# Altium schematic sheet pyPhotometry.SchDoc
size 320 x 200 mm; SheetNumber: 1; SheetTotal: 1
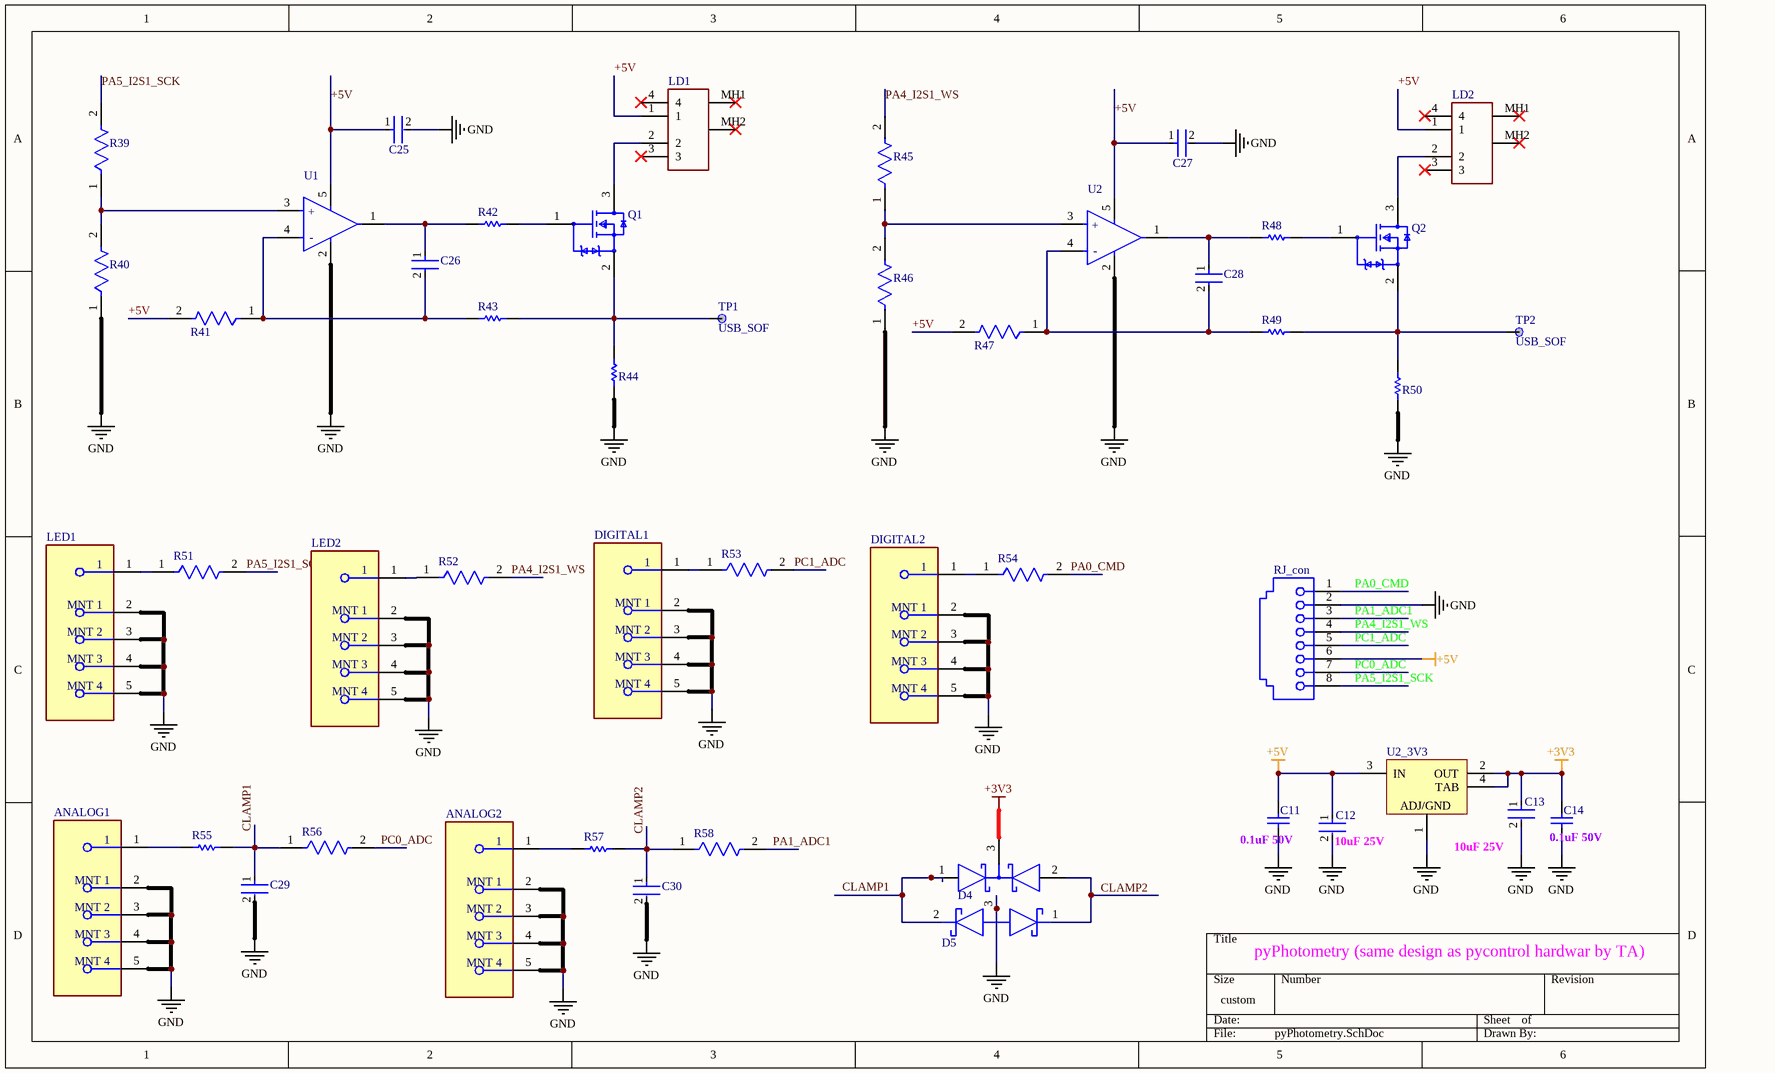
[diagram p0: pyPhotometry.SchDoc]

## Parts
ANALOG1  1-1337445-0  [FP-1-1337445-0-MFG]  (value not drawn)
ANALOG2  1-1337445-0  [FP-1-1337445-0-MFG]  (value not drawn)
C11  GRM188R71H104KA93D  [CAPC1608X90X35ML10T15]  (value not drawn)
C12  CC1206KKX5R8BB105  [FP-CC1206-1_25-MFG]  (value not drawn)
C13  CC1206KKX5R8BB105  [FP-CC1206-1_25-MFG]  (value not drawn)
C14  GRM188R71H104KA93D  [CAPC1608X90X35ML10T15]  (value not drawn)
C25  CC0603KRX7R9BB153  [FP-CC0603-DA-MFG]  (value not drawn)
C26  CC0603KRX7R9BB153  [FP-CC0603-DA-MFG]  (value not drawn)
C27  CC0603KRX7R9BB153  [FP-CC0603-DA-MFG]  (value not drawn)
C28  CC0603KRX7R9BB153  [FP-CC0603-DA-MFG]  (value not drawn)
C29  CC0603KRX7R9BB153  [FP-CC0603-DA-MFG]  (value not drawn)
C30  CC0603KRX7R9BB153  [FP-CC0603-DA-MFG]  (value not drawn)
D4  BAR43CFILM  [FP-SOT23-3L-MFG]  (value not drawn)
D5  BAR43AFILM  [SOT105P242X150-3N]  (value not drawn)
DIGITAL1  1-1337445-0  [FP-1-1337445-0-MFG]  (value not drawn)
DIGITAL2  1-1337445-0  [FP-1-1337445-0-MFG]  (value not drawn)
LD1  T4041037041-000  [T4041037041000]  (value not drawn)
LD2  T4041037041-000  [T4041037041000]  (value not drawn)
LED1  1-1337445-0  [FP-1-1337445-0-MFG]  (value not drawn)
LED2  1-1337445-0  [FP-1-1337445-0-MFG]  (value not drawn)
Q1  DMG2302UK-7  [FP-SOT23-MFG]  (value not drawn)
Q2  DMG2302UK-7  [FP-SOT23-MFG]  (value not drawn)
R39  RT0603FRD07100RL  [FP-RT0603-MFG]  (value not drawn)
R40  RT0603FRD07100RL  [FP-RT0603-MFG]  (value not drawn)
R41  RT0603FRD07100RL  [FP-RT0603-MFG]  (value not drawn)
R42  RC0603JR-071KL  [RESC1608X55X25ML10T15]  (value not drawn)
R43  RC0603JR-071KL  [RESC1608X55X25ML10T15]  (value not drawn)
R44  RC0603JR-071KL  [RESC1608X55X25ML10T15]  (value not drawn)
R45  RT0603FRD07100RL  [FP-RT0603-MFG]  (value not drawn)
R46  RT0603FRD07100RL  [FP-RT0603-MFG]  (value not drawn)
R47  RT0603FRD07100RL  [FP-RT0603-MFG]  (value not drawn)
R48  RC0603JR-071KL  [RESC1608X55X25ML10T15]  (value not drawn)
R49  RC0603JR-071KL  [RESC1608X55X25ML10T15]  (value not drawn)
R50  RC0603JR-071KL  [RESC1608X55X25ML10T15]  (value not drawn)
R51  RT0603FRD07100RL  [FP-RT0603-MFG]  (value not drawn)
R52  RT0603FRD07100RL  [FP-RT0603-MFG]  (value not drawn)
R53  RT0603FRD07100RL  [FP-RT0603-MFG]  (value not drawn)
R54  RT0603FRD07100RL  [FP-RT0603-MFG]  (value not drawn)
R55  RC0603JR-071KL  [RESC1608X55X25ML10T15]  (value not drawn)
R56  RT0603FRD07100RL  [FP-RT0603-MFG]  (value not drawn)
R57  RC0603JR-071KL  [RESC1608X55X25ML10T15]  (value not drawn)
R58  RT0603FRD07100RL  [FP-RT0603-MFG]  (value not drawn)
RJ_con  615008138021  [615008138021]  (value not drawn)
TP1  USB_SOF  [TP]
TP2  USB_SOF  [TP]
U1  OPA197IDBVT  [FP-DBV0005A-IPC_C]  (value not drawn)
U2  OPA197IDBVT  [FP-DBV0005A-IPC_C]  (value not drawn)
U2_3V3  NCP1117ST33T3G  [ONSC-SOT-223-4-318H-01_A_V]  (value not drawn)

## Nets
+3V3: C13.1 C14.2 D4.3(K) U2_3V3.2(OUT) U2_3V3.4(TAB)
+5V: C11.2 C12.1 C25.1 C27.1 LD1.1 LD2.1 R41.2 R47.2 RJ_con.6 U1.5(V+) U2.5(V+) U2_3V3.3(IN)
GND: ANALOG1.2(MNT_1) ANALOG1.3(MNT_2) ANALOG1.4(MNT_3) ANALOG1.5(MNT_4) ANALOG2.2(MNT_1) ANALOG2.3(MNT_2) ANALOG2.4(MNT_3) ANALOG2.5(MNT_4) C11.1 C12.2 C13.2 C14.1 C25.2 C27.2 C29.2 C30.2 D5.3(A) DIGITAL1.2(MNT_1) DIGITAL1.3(MNT_2) DIGITAL1.4(MNT_3) DIGITAL1.5(MNT_4) DIGITAL2.2(MNT_1) DIGITAL2.3(MNT_2) DIGITAL2.4(MNT_3) DIGITAL2.5(MNT_4) LED1.2(MNT_1) LED1.3(MNT_2) LED1.4(MNT_3) LED1.5(MNT_4) LED2.2(MNT_1) LED2.3(MNT_2) LED2.4(MNT_3) LED2.5(MNT_4) R40.1 R44.1 R46.1 R50.1 RJ_con.2 U1.2(V-) U2.2(V-) U2_3V3.1(ADJ/GND)
CLAMP1: C29.1 D4.1(A1) D5.2(K1) R55.2 R56.1
CLAMP2: C30.1 R57.2 R58.1
PA0_CMD: R54.2 RJ_con.1
PA1_ADC1: R58.2 RJ_con.3
PA4_I2S1_WS: R45.2 R52.2 RJ_con.4
PA5_I2S1_SCK: R39.2 R51.2 RJ_con.8
PC0_ADC: R56.2 RJ_con.7
PC1_ADC: R53.2 RJ_con.5
NetANALOG1_1: ANALOG1.1 R55.1
NetANALOG2_1: ANALOG2.1 R57.1
NetC26_1: C26.1 R42.1 U1.1(OUT)
NetC26_2: C26.2 R41.1 R43.1 U1.4(-IN)
NetC28_1: C28.1 R48.1 U2.1(OUT)
NetC28_2: C28.2 R47.1 R49.1 U2.4(-IN)
NetD4_2: D4.2(A2) D5.1(K2)
NetDIGITAL1_1: DIGITAL1.1 R53.1
NetDIGITAL2_1: DIGITAL2.1 R54.1
NetLD1_2: LD1.2 Q1.3(D)
NetLD2_2: LD2.2 Q2.3(D)
NetLED1_1: LED1.1 R51.1
NetLED2_1: LED2.1 R52.1
NetQ1_1: Q1.1(G) R42.2
NetQ1_2: Q1.2(S) R43.2 R44.2 TP1.1
NetQ2_1: Q2.1(G) R48.2
NetQ2_2: Q2.2(S) R49.2 R50.2 TP2.1
NetR39_1: R39.1 R40.2 U1.3(+IN)
NetR45_1: R45.1 R46.2 U2.3(+IN)

Not connected (* = marked no-connect by the designer): LD1 3* 4* MH1* MH2*; LD2 3* 4* MH1* MH2*

## Notes on the sheet
- (near C11) 0.1uF 50V
- (near C12) 10uF 25V
- 10uF 25V
- (near C14) 0.1uF 50V
- pyPhotometry (same design as pycontrol hardwar by TA)
- Labels drawn without touching a wire or pin: CLAMP2
- (in symbol CMP-04895-000163-1) +; -

## Library data of the parts
ANALOG1 ANALOG2 DIGITAL1 DIGITAL2 = CMP-03357-000006-1: CONN BNC JACK STR 50 OHM PCB; PCB Mount Retention: With; Operating Frequency: 0 to 4Hz; PCB Mounting Orientation: Vertical; PCB Thickness: 0.126inch; Body Plating: Silver; Frequency: 4GHz; Impedance: 50R; Insulation Resistance: 5GR; Body Material: Brass; Dielectric Material: PTFE; Gender: Female; Sealable: No (Without); Number of Positions: 1; Orientation: Straight; RoHS Compliant: Yes; Min Operating Temperature: -65°C; Packaging: Bag; Fastening Type: Bayonet; Radiation Hardening: No; Max Frequency: 4GHz; Material: Brass; Contact Plating: Silver; ELV: Compliant; Depth: 12mm; Series: BNC; Package Quantity: 50; Connector Type: BNC; Contact Material: Brass; Max Operating Temperature: 165°C; Length: 12mm; Termination: Solder; Mount: Through Hole; Insulation Material: Polytetrafluoroethylene
C11 C14 = CMP-2100-03643-1: Chip Capacitor, 0.1 uF, +/- 10%, 50 V, -55 to 125 degC, 0603 (1608 Metric), RoHS, Tape and Reel (C77055); Manufacturer: Murata; Dielectric Material: Ceramic; Voltage Rating: 50V; Capacitance: 100nF; Dielectric: X7R; Insulation Resistance: 10GR; Case Code (Metric): 1608; Lead Free: LeadFree; Depth: 0.8mm; Number of Pins: 2; Radiation Hardening: No; Case/Package: 0603; Manufacturer URL: http://www.murata.com/; Packaging: TapeandReel; Length: 1.6mm; Contact Plating: Tin; Datasheet URL: http://psearch.en.murata.com/capacitor/product/GRM188R71H104KA93%23.pdf; Tolerance: 10%; Case Code (Imperial): 0603; Min Operating Temperature: -55degC; RoHSCompliant: true; Voltage: 50V; Termination: SMD/SMT; Mount: SurfaceMount; Material: Ceramic; Package Quantity: 1; Height: 0.8mm; Thickness: 0.035inch; REACH SVHC: NoSVHC; Max Operating Temperature: 125degC; Width: 0.8mm; Package Reference: 0603; Voltage Rating (DC): 50V; Datasheet Version: 42675.0; Package Description: 2-Pin Surface Mount Device, Body 1.6 x 0.8 mm
C12 C13 = CMP-03422-001167-1: 10uF 25V X5R ±10% 1206 Multilayer Ceramic Capacitors MLCC - SMD/SMT ROHS (C128855); Manufacturer: Yageo; Temperature Coefficient: 15%; Value: 1 uF; Tolerance: 0.1; Automotive Grade: NA; Temperature: -55°C to +125°C; Footprint Url: http://www.yageo.com/exep/pages/download/literatures/UPY-C_GEN_24.pdf; Lead Free: Yes; Device Class L2: Capacitors; Temperature Range High: +125°C; Manufacturer Part Number: CC1206KKX5R8BB105; Voltage Rating: 25 V; ComponentLink2Description: Datasheet; Device Class L3: Ceramic Capacitors; RoHS: TRUE; Temperature Characteristic: X5R; Digikey Description: CAP CER 1UF 25V X5R 1206; Mouser Description: Multilayer Ceramic Capacitors MLCC - SMD/SMT 1.0uF 25V X5R 10%; Capacitance: 1 uF; Material: Ceramic; Height: 1.45mm; Automotive: No; Category: Cap; Octopart: https://octopart.com/cc1206kkx5r8bb105-yageo-20779154; ComponentLink2URL: http://www.yageo.com/documents/recent/UPY-NP0X7R_HV_1KV-to-3KV_11.pdf; Package: CC1206-1.25; Device Class L1: Passive Components; Temperature Range Low: -55°C
C25-C30 = CMP-03422-000725-1: CAP CER 0.015UF 50V X7R 0603 (C107076); Manufacturer: YAGEO; Tolerance: 0.1; Value: 15 nF; Material: Ceramic; Temperature Coefficient: 15%; Automotive: No; Height: 0.9mm; Device Class L3: Ceramic Capacitors; Category: Cap; Octopart: https://octopart.com/cc0603krx7r9bb153-yageo-42334129; Device Class L2: Capacitors; Digikey Description: CAP CER 0.015UF 50V X7R 0603; Manufacturer Part Number: CC0603KRX7R9BB153; Device Class L1: Passive Components; Footprint Url: http://www.yageo.com/exep/pages/download/literatures/UPY-C_GEN_24.pdf; Capacitance: 15 nF; ComponentLink2URL: http://www.yageo.com/documents/recent/UPY-GPHC_X7R_6.3V-to-50V_18.pdf; Temperature: -55°C to +125°C; Voltage: 50 V; Temperature Characteristic: X7R; Voltage Rating: 50 V; Mouser Description: Multilayer Ceramic Capacitors MLCC - SMD/SMT 15nF 50V X7R 10%; ComponentLink2Description: Datasheet; Lead Free: Yes; RoHS: TRUE; Package: CC0603-DA; Temperature Range Low: -55°C; Temperature Range High: +125°C
D4 = CMP-12187-000004-1: DIODE ARRAY SCHOTTKY 30V SOT23-3 (C69290); Manufacturer: STMicroelectronics; Peak Reverse Current: 0.5uA; Forward Current: 0.1A; Standoff Height: 0mm; Capacitance: 7pF; Max Surge Forward Current: 0.75A; Value: 7pF; Max Junction Temp: +150°C; ComponentLink2Description: Datasheet; Device Class L2: Diodes; Temperature Range High: +150°C; Device Class L1: Discrete Semiconductors; ComponentLink2URL: https://www.st.com/resource/en/datasheet/bar43.pdf; Package: SOT23-3L; Lead Free: Yes; Temperature: to +150°C; Category: Diode; Digikey Description: DIODE ARRAY SCHOTTKY 30V SOT23-3; Manufacturer Part Number: BAR43CFILM; Automotive: No; Mouser Description: Schottky Diodes & Rectifiers 100mA 30 Volt; Height: 1.5mm; Max Repetitive Reverse Voltage: 30V; RoHS: TRUE; Octopart: https://octopart.com/bar43cfilm-stmicroelectronics-39683191; Device Class L3: Schottky Diodes; Reverse Voltage: 30V
D5 = BAR43AFILM: Schottky Diode with Dual Cathode; Manufacturer_Name: STMicroelectronics; Datasheet Link: http://www.st.com/web/en/resource/technical/document/datasheet/CD00000764.pdf; Height: 1.5mm; Manufacturer_Part_Number: BAR43AFILM; Mouser Part Number: 511-BAR43AFILM; Mouser Price/Stock: https://www.mouser.co.uk/ProductDetail/STMicroelectronics/BAR43AFILM?qs=V1woAGgG1aNxI05DoB34wA%3D%3D; Arrow Part Number: BAR43AFILM; Arrow Price/Stock: https://www.arrow.com/en/products/bar43afilm/stmicroelectronics?utm_currency=USD&region=europe
LD1 LD2 = T4041037041-000: Connector; Manufacturer_Name: TE Connectivity; Datasheet Link: https://www.te.com/commerce/DocumentDelivery/DDEController?Action=srchrtrv&DocNm=1-1773701-8_M8M12_CONNECTOR_SYSTEM&DocType=Catalog%20Section&DocLang=Japanese&PartCntxt=T4041037041-000&DocFormat=pdf; Height: 15.25mm; Manufacturer_Part_Number: T4041037041-000; Mouser Part Number: 571-T4041037041-000; Mouser Price/Stock: https://www.mouser.co.uk/ProductDetail/TE-Connectivity/T4041037041-000?qs=1mbolxNpo8e0ryuUhGdttQ%3D%3D; Arrow Part Number: T4041037041-000; Arrow Price/Stock: https://www.arrow.com/en/products/t4041037041-000/te-connectivity?utm_currency=USD&region=europe
LED1 LED2 = CMP-03357-000006-1: CONN BNC JACK STR 50 OHM PCB; PCB Mount Retention: With; Operating Frequency: 0 to 4Hz; PCB Mounting Orientation: Vertical; PCB Thickness: 0.126inch; Body Plating: Silver; Frequency: 4GHz; Impedance: 50R; Insulation Resistance: 5GR; Material: Brass; Dielectric Material: PTFE; Gender: Female; Sealable: No (Without); Number of Positions: 1; Orientation: Straight; RoHS Compliant: Yes; Min Operating Temperature: -65°C; Packaging: Bag; Fastening Type: Bayonet; Radiation Hardening: No; Max Frequency: 4GHz; Contact Plating: Silver; ELV: Compliant; Body Material: Brass; Depth: 12mm; Series: BNC; Package Quantity: 50; Connector Type: BNC; Contact Material: Brass; Max Operating Temperature: 165°C; Length: 12mm; Termination: Solder; Mount: Through Hole; Insulation Material: Polytetrafluoroethylene
Q1 Q2 = CMP-12801-000001-1: MOSFET N-CH 20V 2.8A SOT23; Manufacturer: Diodes Inc.; Reverse Recovery Time: 5.3ns; Gate Charge At Vgs: 2.8nC @ 10V; Turn On Delay Time: 0.6ns; Pulse Drain Current: 12A; Max Forward Diode Voltage: 1.2V; Reverse Recovery Charge: 0.5nC; Automotive Grade: Grade 0; Threshold Vgs Min: 0.3V; Number Of N Channels: 1; Standoff Height: 0.013mm; Typ Forward Diode Voltage: 0.7V; Drain To Source Resistance: 61mΩ; Rthja Max: 192°C/W; Max Junction Temp: +150°C; Input Capacitace At Vds: 130pF @ 10V; Threshold Vgs Max: 1V; Turn Off Delay Time: 4.2ns; Depletion Mode: False; Gate To Source Voltage: 12V; Power Dissipation: 0.66W; Device Class L1: Discrete Semiconductors; Footprint Url: https://www.diodes.com/assets/Package-Files/SOT23.pdf; Lead Free: Yes; Manufacturer Part Number: DMG2302UK-7; Temperature Range High: +150°C; Drain To Source Voltage: 20V; Category: Trans; Digikey Description: MOSFET N-CH 20V 2.8A SOT23; RoHS: TRUE; Device Class L2: Transistors; Height: 1.1mm; Automotive: Yes; Package: SOT23; Drain To Source Breakdown Voltage: 20V; Continuous Drain Current: 2.8A; ComponentLink2Description: Datasheet; Device Class L3: MOSFETs; Octopart: https://octopart.com/dmg2302uk-7-diodes+inc.-73850182; Temperature Range Low: -55°C; Temperature: -55°C to +150°C; Number Of Channels: 1; ComponentLink2URL: https://www.diodes.com/assets/Datasheets/DMG2302UK.pdf
R39-R41 R45-R47 R51-R54 R56 R58 = CMP-03412-020531-1: RES SMD 100 OHM 1% 1/10W 0603 (C160603)s; Manufacturer: Yageo; Value: 100Ω; Power Rating: 0.1W; Voltage Rating: 75V; Tolerance: 0.01; Temperature Coefficient: 25 ppm/°C; Device Class L2: Resistors; Temperature Range Low: -55°C; ComponentLink2Description: Datasheet; Digikey Description: RES SMD 100 OHM 1% 1/10W 0603; Category: Res; Composition: Thin Film; Mouser Description: High Precision-High Stability Chip Resistor Thin Film 0603 100Ohm 1% Paper T/R; Temperature Range High: +155°C; RoHS: TRUE; Device Class L3: Chip SMD Resistors; Footprint Url: http://www.yageo.com/exep/pages/download/literatures/PYu-R_Mount_10.pdf; Octopart: https://octopart.com/rt0603frd07100rl-yageo-71395265; Manufacturer Part Number: RT0603FRD07100RL; ComponentLink2URL: http://www.yageo.com/documents/recent/PYu-RT_1-to-0.01_RoHS_L_9.pdf; Temperature: -55°C to +155°C; Lead Free: Yes; Height: 0.55mm; Device Class L1: Passive Components; Package: RT0603; Automotive: No; Series: RT; Ipc Land Pattern Name: RESC16080X45; Resistance: 100Ω
R42-R44 R48-R50 R55 = CMP-2000-05023-1: Chip Resistor, 1 KOhm, +/- 5%, 0.063 W, -55 to 155 degC, 0603 (1608 Metric), RoHS, Tape and Reel (C14676); Manufacturer: Yageo; Resistor Case Style: 0603[1608Metric]; Resistor Element Type: ThickFilm; Product Range: RCSeries; Resistance: 1kohm; SVHC: ToBeAdvised; Voltage Rating: 50V; Temperature Coefficient: ±100ppm/degC; Power Rating: 100mW; Packaging: CutTape; Manufacturer URL: http://www.yageo.com/; Resistance Tolerance: ±5%; Datasheet Version: Rev. 4, 04/2009; MSL: MSL1-Unlimited; Package Description: 2-Pin Surface Mount Device, Body 1.6 x 0.8 mm; Automotive Qualification Standard: -; Package Reference: 603; Datasheet URL: https://datasheet.ciiva.com/2452/pyu-rc0603-51-rohs-l-4-2452848.pdf
R57 = CMP-2000-05023-1: Chip Resistor, 1 KOhm, +/- 5%, 0.063 W, -55 to 155 degC, 0603 (1608 Metric), RoHS, Tape and Reel (C14676)s; Manufacturer: Yageo; Resistor Case Style: 0603[1608Metric]; Resistor Element Type: ThickFilm; Product Range: RCSeries; Resistance: 1kohm; SVHC: ToBeAdvised; Voltage Rating: 50V; Temperature Coefficient: ±100ppm/degC; Power Rating: 100mW; Packaging: CutTape; Manufacturer URL: http://www.yageo.com/; Resistance Tolerance: ±5%; Datasheet Version: Rev. 4, 04/2009; MSL: MSL1-Unlimited; Package Description: 2-Pin Surface Mount Device, Body 1.6 x 0.8 mm; Automotive Qualification Standard: -; Package Reference: 603; Datasheet URL: https://datasheet.ciiva.com/2452/pyu-rc0603-51-rohs-l-4-2452848.pdf
RJ_con = CMP-1502-01725-1: Modular Jack WR-MJ, Plastic, Vertical Entry, THT, 8P8C (C86492); Manufacturer: Wurth Elektronik; Withstanding Voltage: 1000VAC; Contact Resistance: 20mOhm; Port: 1x1; Working Voltage: 120VAC; Rated Current: 1.5A; Compliance: Leadfree/RoHS; Entrance: Vertical; Publisher: WurthElektronik; Datasheet URL: https://katalog.we-online.de/em/datasheet/615008138021.pdf; Part Number: 615008138021; Manufacturer URL: http://www.we-online.de; Pin Number: 8P8C; Mounting Technology: THT; Operating Temperature: -40to85degC; Package Reference: 615008138021; Packaging: Tray
TP1 TP2 = TP
U1 U2 = CMP-04895-000163-1: IC OPAMP GP 1 CIRCUIT SOT23-5; Output Current per Channel: 65mA; Number of Channels: 1; Input Offset Voltage (Vos): 25uV; Operating Supply Current: 1mA; Gain Bandwidth Product: 10MHz; Input Bias Current: 5pA; Slew Rate: 20V/µs; Lead Free: Lead Free; Number of Pins: 5; REACH SVHC: No SVHC; Number of Amplifiers: 1; Number of Circuits: 1; Max Operating Temperature: 125°C; Packaging: Cut Tape; Mount: Surface Mount; Min Operating Temperature: -40°C; Case/Package: SOT-23-5; Bandwidth: 10MHz; RoHS Compliant: Yes
U2_3V3 = CMP-1679-00010-1: Low-Dropout Positive Fixed Voltage Regulator, 1 A, 3.3 V Output Voltage, 0 to 125 degC, 4-Pin SOT-223 (318H-01), Pb-Free, Tape and Reel (C26537); Resistance: 220 kohm; Type (Resistor): Thick Film; Voltage Rating: 75 V; Tolerance: 1%; Case\Package: 0603; Power Rating: 100 mW; Width: 0.85 mm; Weight: 7.1E-05 oz; ComponentLink2URL: http://www.onsemi.com/pub_link/Collateral/NCP1117-D.PDF; RoHSCompliant: true; Height: 0.45 mm; PackageDescription: 4-Pin Small Outline Transistor, Body 6.5 x 3.5 mm, Pitch 2.3 mm; ComponentLink1Description: Manufacturer URL; ComponentLink1URL: http://www.onsemi.com/; PackageReference: SOT-223-4-318H-01_A; Max Operating Temperature: 155 degC; Packaging: Tape and Reel; REACH SVHC: Unknown; Length: 1.55 mm; Package Quantity: 5000; Radiation Hardening: No; Min Operating Temperature: -55 degC; DatasheetVersion: Rev. 27, 09/2014; Mount: Surface Mount; Case Code (Imperial): 0603; Case Code (Metric): 1608; ComponentLink2Description: Datasheet